# Altium schematic sheet MOS.schdoc
size 297 x 209 mm; Symbol: Drawing-Symbol_A4; Company: 上海道尔汇控智能科技有限公司; Version: V1.2; Page Size: A4; @Project Name: YTM32; @Page Count: 5; @Update Date: 2025-12-28; @Create Date: 2025-10-20; @Schematic Name: YTM32_MotorControl; @Page No: 1; @Page Name: MOS; @Create Time: 16:42:20; @Update Time: 16:22:08; Border: 1; Width: 1170; Height: 825; Region Start: 1; X Region Count: 6; Y Region Count: 4; Blade Width: 10; Title Block Position: 3; @Board Name: YTM32_MotorControl; Device: Drawing-Symbol_A4
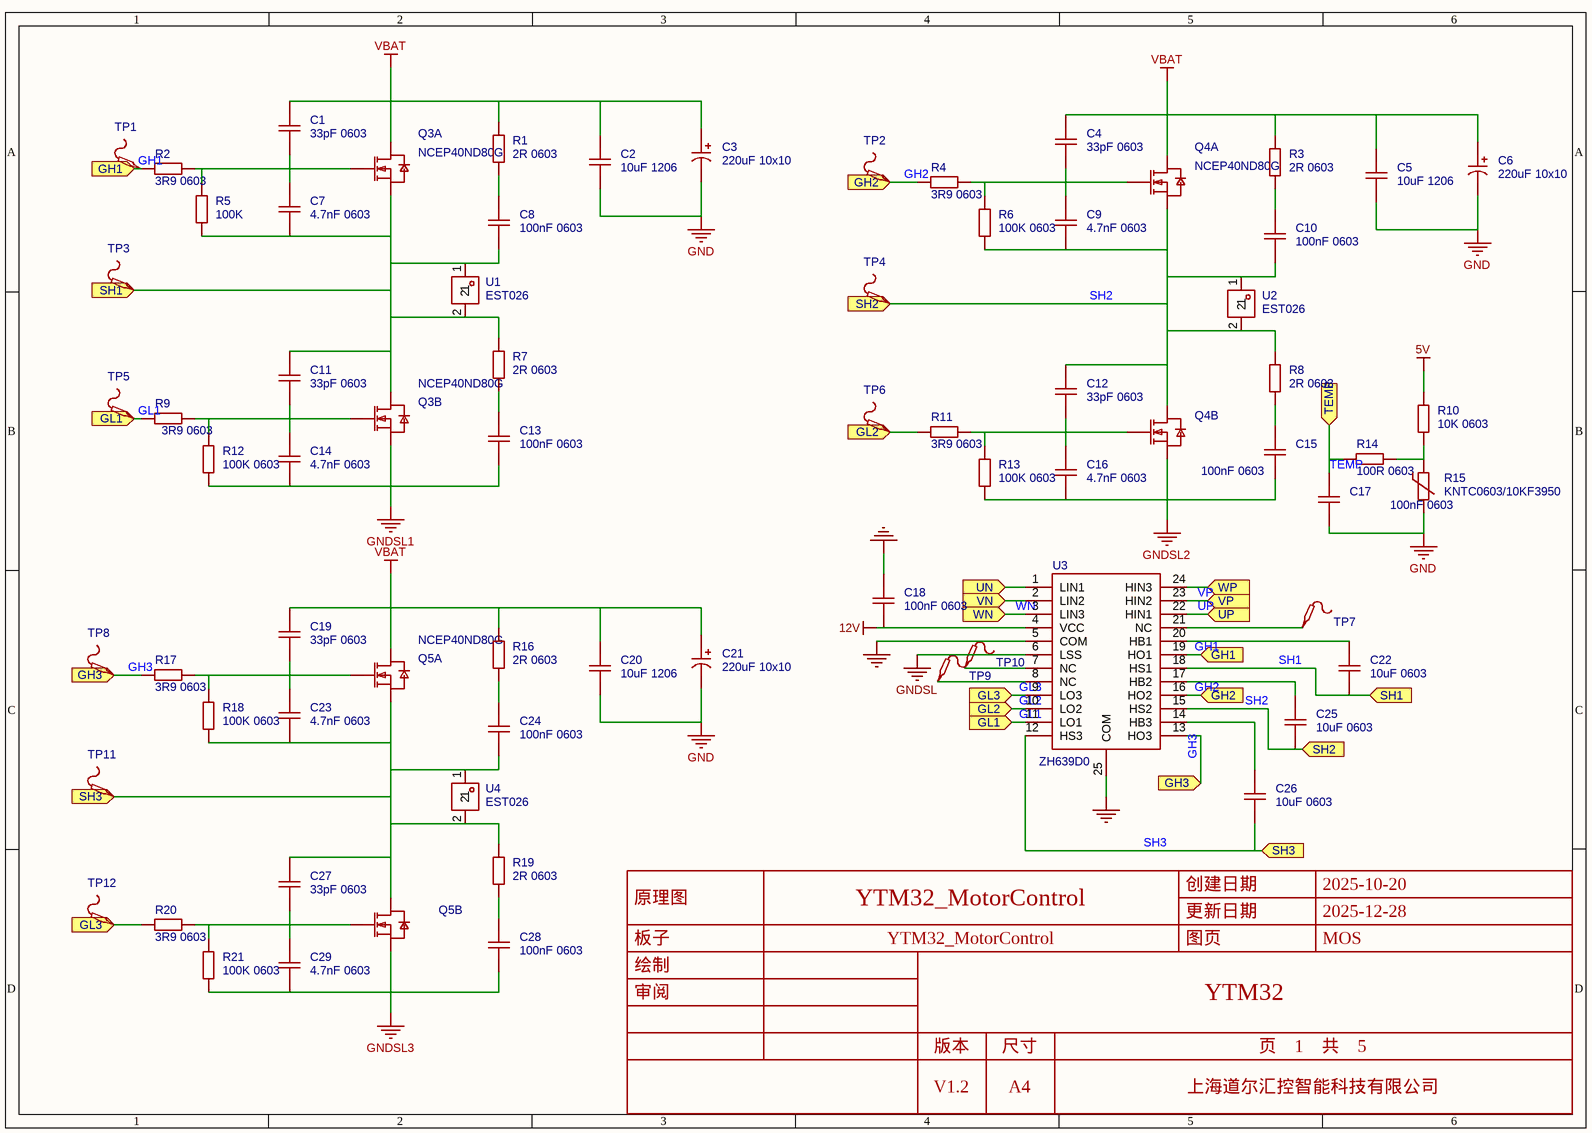
[diagram p0: MOS.schdoc]

## Parts
C1  33pF 0603  [C0603]
C2  10uF 1206  [C1206]
C3  220uF 10x10  [CAP-SMD_BD10.0-L10.3-W10.3-LS11.7-FD]
C4  33pF 0603  [C0603]
C5  10uF 1206  [C1206]
C6  220uF 10x10  [CAP-SMD_BD10.0-L10.3-W10.3-LS11.7-FD]
C7  4.7nF 0603  [C0603]
C8  100nF 0603  [C0603]
C9  4.7nF 0603  [C0603]
C10  100nF 0603  [C0603]
C11  33pF 0603  [C0603]
C12  33pF 0603  [C0603]
C13  100nF 0603  [C0603]
C14  4.7nF 0603  [C0603]
C15  100nF 0603  [C0603]
C16  4.7nF 0603  [C0603]
C17  100nF 0603  [C0603]
C18  100nF 0603  [C0603]
C19  33pF 0603  [C0603]
C20  10uF 1206  [C1206]
C21  220uF 10x10  [CAP-SMD_BD10.0-L10.3-W10.3-LS11.7-FD]
C22  10uF 0603  [C0603]
C23  4.7nF 0603  [C0603]
C24  100nF 0603  [C0603]
C25  10uF 0603  [C0603]
C26  10uF 0603  [C0603]
C27  33pF 0603  [C0603]
C28  100nF 0603  [C0603]
C29  4.7nF 0603  [C0603]
Q3  NCEP40ND80G  [DFN-8_L5.5-W5.2-P1.27-LS6.0-BL-EP2]  (parts A,B of 2)
Q4  NCEP40ND80G  [DFN-8_L5.5-W5.2-P1.27-LS6.0-BL-EP2]  (parts A,B of 2)
Q5  NCEP40ND80G  [DFN-8_L5.5-W5.2-P1.27-LS6.0-BL-EP2]  (parts A,B of 2)
R1  2R 0603  [R0603]
R2  3R9 0603  [R0603]
R3  2R 0603  [R0603]
R4  3R9 0603  [R0603]
R5  100K  [R0603]
R6  100K 0603  [R0603]
R7  2R 0603  [R0603]
R8  2R 0603  [R0603]
R9  3R9 0603  [R0603]
R10  10K 0603  [R0603]
R11  3R9 0603  [R0603]
R12  100K 0603  [R0603]
R13  100K 0603  [R0603]
R14  100R 0603  [R0603]
R15  KNTC0603/10KF3950  [R0603]
R16  2R 0603  [R0603]
R17  3R9 0603  [R0603]
R18  100K 0603  [R0603]
R19  2R 0603  [R0603]
R20  3R9 0603  [R0603]
R21  100K 0603  [R0603]
TP1  (no value)  [Test-Point-0.5mm]
TP2  (no value)  [Test-Point-0.5mm]
TP3  (no value)  [Test-Point-0.5mm]
TP4  (no value)  [Test-Point-0.5mm]
TP5  (no value)  [Test-Point-0.5mm]
TP6  (no value)  [Test-Point-0.5mm]
TP7  (no value)  [Test-Point-0.5mm]
TP8  (no value)  [Test-Point-0.5mm]
TP9  (no value)  [Test-Point-0.5mm]
TP10  (no value)  [Test-Point-0.5mm]
TP11  (no value)  [Test-Point-0.5mm]
TP12  (no value)  [Test-Point-0.5mm]
U1  EST026  [CONN-TH_L6.3-W0.8-EST026]
U2  EST026  [CONN-TH_L6.3-W0.8-EST026]
U3  (no value)  [QFN24_L4.0-W4.0-P0.5-TL-EP2.45]
U4  EST026  [CONN-TH_L6.3-W0.8-EST026]

## Ports
GH1 (in), GH2 (in), GH3 (in), GL1 (in), GL2 (in), GL3 (in), SH1 (in), SH2 (in), SH3 (in), TEMP (in), UN (in), UP (in), VN (in), VP (in), WN (in), WP (in)

## Nets
5V: R10.1
12V: C18.1 U3.4(VCC)
GND: C2.1 C3.2 C5.1 C6.2 C17.1 C18.2 C20.1 C21.2 R15.2 U3.5(COM) U3.25(COM)
GNDSL: U3.6(LSS)
GNDSL1: C13.1 C14.1 Q3.3(S2) R12.1
GNDSL2: C15.1 C16.1 Q4.3(S2) R13.1
GNDSL3: C28.1 C29.1 Q5.3(S2) R21.1
VBAT: C1.2 C2.2 C3.1 C4.2 C5.2 C6.1 C19.2 C20.2 C21.1 Q3.6(D1) Q4.6(D1) Q5.6(D1) R1.1 R3.1 R16.1
GH1: R2.2 TP1.1 U3.19(HO1) ; port GH1
GH2: R4.2 TP2.1 U3.16(HO2) ; port GH2
GH3: R17.2 TP8.1 U3.13(HO3) ; port GH3
GL1: R9.2 TP5.1 U3.11(LO1) ; port GL1
GL2: R11.2 TP6.1 U3.10(LO2) ; port GL2
GL3: R20.2 TP12.1 U3.9(LO3) ; port GL3
SH1: C7.1 C8.1 C11.2 C22.1 Q3.1(S1) Q3.5(D2) R5.1 R7.1 TP3.1 U1.1 U1.2 U3.18(HS1) ; port SH1
SH2: C9.1 C10.1 C12.2 C25.1 Q4.1(S1) Q4.5(D2) R6.1 R8.1 TP4.1 U2.1 U2.2 U3.15(HS2) ; port SH2
SH3: C23.1 C24.1 C26.1 C27.2 Q5.1(S1) Q5.5(D2) R18.1 R19.1 TP11.1 U3.12(HS3) U4.1 U4.2 ; port SH3
TEMP: C17.2 R14.2 ; port TEMP
UN: U3.1(LIN1) ; port UN
UP: U3.22(HIN1) ; port UP
VN: U3.2(LIN2) ; port VN
VP: U3.23(HIN2) ; port VP
WN: U3.3(LIN3) ; port WN
WP: U3.24(HIN3) ; port WP
NetC1_1: C1.1 C7.2 Q3.2(G1) R2.1 R5.2
NetC4_1: C4.1 C9.2 Q4.2(G1) R4.1 R6.2
NetC8_2: C8.2 R1.2
NetC10_2: C10.2 R3.2
NetC11_1: C11.1 C14.2 Q3.4(G2) R9.1 R12.2
NetC12_1: C12.1 C16.2 Q4.4(G2) R11.1 R13.2
NetC13_2: C13.2 R7.2
NetC15_2: C15.2 R8.2
NetC19_1: C19.1 C23.2 Q5.2(G1) R17.1 R18.2
NetC22_2: C22.2 U3.20(HB1)
NetC24_2: C24.2 R16.2
NetC25_2: C25.2 U3.17(HB2)
NetC26_2: C26.2 U3.14(HB3)
NetC27_1: C27.1 C29.2 Q5.4(G2) R20.1 R21.2
NetC28_2: C28.2 R19.2
NetR10_2: R10.2 R14.1 R15.1
NetTP7_1: TP7.1 U3.21(NC)
NetTP9_1: TP9.1 U3.8(NC)
NetTP10_1: TP10.1 U3.7(NC)

## Notes on the sheet
- 创建日期
- 2025-10-20
- 原理图
- 板子
- YTM32_MotorControl
- 更新日期
- 图页
- 2025-12-28
- MOS
- 绘制
- 审阅
- YTM32
- 版本
- V1.2
- 尺寸
- A4
- 页    1    共    5
- 上海道尔汇控智能科技有限公司

## Library data of the parts
C1 C4 C7-C19 C22-C29 = CAP_0603: ConvertToPcb: yes; SymbolName: CapAcitance; ModelId: ac125912035d415993ca9572d50418b1; ModelName: C0603_L1.6-W0.8-H0.8; ModelTransform: 62.992,31.496,0,0,0,0,0,0,0; Device: CAP_0603; AddInBom: yes; Supplier Footprint: 0603; FootprintName: C0603
  C1 C4 C11 C12 C19 C27: Value: 33pF 0603
  C7 C9 C14 C16 C23 C29: Value: 4.7nF 0603
  C8 C10 C13 C15 C17 C18 C24 C28: Value: 100nF 0603
  C22 C25 C26: Value: 10uF 0603
C2 C5 C20 = CAP_1206: ConvertToPcb: yes; SymbolName: CapAcitance; ModelId: e4be705b945545a48e666415e3682bd8; ModelName: C1206_L3.2-W1.6-H1.3; ModelTransform: 125.984,62.992,0,0,0,0,0,0,0; Value: 10uF 1206; Device: CAP_1206; AddInBom: yes; Supplier Footprint: 1206; FootprintName: C1206
C3 C6 C21 = JVJ50V220M10x10: 容值:220uF;精度:±20%;额定电压:50V;纹波电流:220mA@120Hz;; Manufacturer: JIERR(捷而瑞); AddInBom: yes; ModelId: 50f22ba8977a4cb2b51f8d950fa665c3; ModelTransform: 456.692,405.511,0,0,0,0,0,0,0; Tolerance: ±20%; Voltage Rating: 50V; Lifetime: 2000hrs@105℃; Symbol: JVJ50V220M10X10; Value: 220uF 10x10; Device: JVJ50V220M10x10; LCSC Part Name: 220uF ±20% 50V; ManufacturerPart: JVJ50V220M10x10; Supplier Footprint: SMD,D10xL10.5mm; JLCPCB Part Class: 扩展库; Datasheet: https://item.szlcsc.com/datasheet/JVJ50V220M10x10/48680111.html; Supplier: LCSC; ConvertToPcb: yes; FootprintName: CAP-SMD_BD10.0-L10.3-W10.3-LS11.7-FD; ModelName: CAP-SMD_BD10.0-L10.3-W10.3-LS11.7-FD; Ripple Current: 220mA@120Hz; Diameter: 10mm; Height - Seated (Max): 10.5mm; Operating Temperature: -55℃~+105℃
Q3-Q5 = YJGD20G10B: 漏源电压(Vdss):100V;连续漏极电流(Id):20A;导通电阻(RDS(on)):19mΩ@10V;耗散功率(Pd):69W;阈值电压(Vgs(th)):2.5V@250uA;; Manufacturer: YANGJIE(扬杰); Relevance: []; AddInBom: yes; ModelId: a5dd95fb0bf9452983fccb4b59393c2b; ModelName: DFN-8_L5.5-W5.2-H1.0-P1.27; ModelTransform: 217.322,205.511,0,90,0,0,0,45.65,0; Drain to Source Voltage: 100V; Current - Continuous Drain(Id): 20A; Pd - Power Dissipation: 69W; Gate Charge(Qg): 20nC@10V; Input Capacitance(Ciss): 1.15nF; Reverse Transfer Capacitance (Crss@Vds): 8pF; Type: N沟道; Output Capacitance(Coss): 430pF; Manufacturer Part: NCEP40ND80G; Symbol: YJGD20G10B; Device: YJGD20G10B; LCSC Part Name: N沟道及N沟道互补MOSFET; SupplierPart: C20605824; Supplier Footprint: PDFN5060-8L-Dual; JLCPCB Part Class: 扩展库; Datasheet: https://item.szlcsc.com/datasheet/YJGD20G10B/21946556.html; Supplier: LCSC; ConvertToPcb: yes; FootprintName: DFN-8_L5.5-W5.2-P1.27-LS6.0-BL-EP2; RDS(on): 19mΩ@10V; Gate Threshold Voltage (Vgs(th)): 2.5V@250uA
R1-R14 R16-R21 = Res_0603: Symbol: 电阻; ConvertToPcb: yes; ModelId: fc143cca1e79419f9cd78b61e9279f08; ModelTransform: 31.8897,63.7794,0,90,0,0,0,0,0; Device: Res_0603; AddInBom: yes; Supplier Footprint: 0603; FootprintName: R0603; ModelName: R0603
  R1 R3 R7 R8 R16 R19: Value: 2R 0603
  R2 R4 R9 R11 R17 R20: Value: 3R9 0603
  R5: Value: 100K
  R6 R12 R13 R18 R21: Value: 100K 0603
  R10: Value: 10K 0603
  R14: Value: 100R 0603
R15 = KNTC0603/10KF3950: 阻值:10kΩ;B值(25℃/50℃):3987K;电阻精度:±1%;功率:100mW;B值精度:±1%;最大稳态电流(25℃):310uA;; Manufacturer: KUU; AddInBom: yes; ModelId: fc143cca1e79419f9cd78b61e9279f08; ModelTransform: 31.8897,63.7794,0,90,0,0,0,0,0; Resistance @ 25℃: 10kΩ; B Constant (25℃/50℃): 3987K; Resistance Tolerance: ±1%; Power(Watts): 100mW; Steady State Current (Max): 310uA; Dissipation Factor: 1mW/℃; Thermal Time Constant: 5s; Symbol: KNTC0603/10KF3950; Device: KNTC0603/10KF3950; LCSC Part Name: 10kΩ 3950K 100mW; SupplierPart: C2892547; ManufacturerPart: KNTC0603/10KF3950; Supplier Footprint: 0603; JLCPCB Part Class: 扩展库; Datasheet: https://item.szlcsc.com/datasheet/KNTC0603%252F10KF3950/3124166.html; Supplier: LCSC; ConvertToPcb: yes; FootprintName: R0603; ModelName: R0603; B Constant (25℃/75℃): -; B Constant (25℃/85℃): 3987K; B Constant (25℃/100℃): -; B Constant Tolerance: ±1%; Operating Temperature: -40℃~+125℃; Length: 1.6mm; Width: 0.8mm; Height: 0.8mm
TP1-TP12 = Test-Point: Test Point 测试点; AddInBom: yes; Device: Test-Point; ConvertToPcb: yes; SymbolName: Test-Point; FootprintName: Test-Point-0.5mm
U1 U2 U4 = EST026: 环保; Manufacturer: xcfuse(旭程); AddInBom: yes; ModelId: caeb915258b34f389ee2048176497ca2; ModelTransform: 328.7395,78.74,0,0,0,0,0,0,-137.795; Symbol: EST026; Device: EST026; LCSC Part Name: EST026; SupplierPart: C52878; ManufacturerPart: EST026; Supplier Footprint: 插件; JLCPCB Part Class: 扩展库; Datasheet: https://item.szlcsc.com/datasheet/EST026/53893.html; Supplier: LCSC; ConvertToPcb: yes; FootprintName: CONN-TH_L6.3-W0.8-EST026; ModelName: CONN-TH_L6.3-W0.8-EST026
U3 = ZH639D0: 车规三相预驱; AddInBom: yes; Device: ZH639D0; SymbolName: ZH639D0; ConvertToPcb: yes; FootprintName: QFN24_L4.0-W4.0-P0.5-TL-EP2.45